# Altium schematic sheet Phaser.SchDoc: =DocumentName
size A3; DocumentNumber: 1; Revision: 0; SheetNumber: 1; SheetTotal: 30
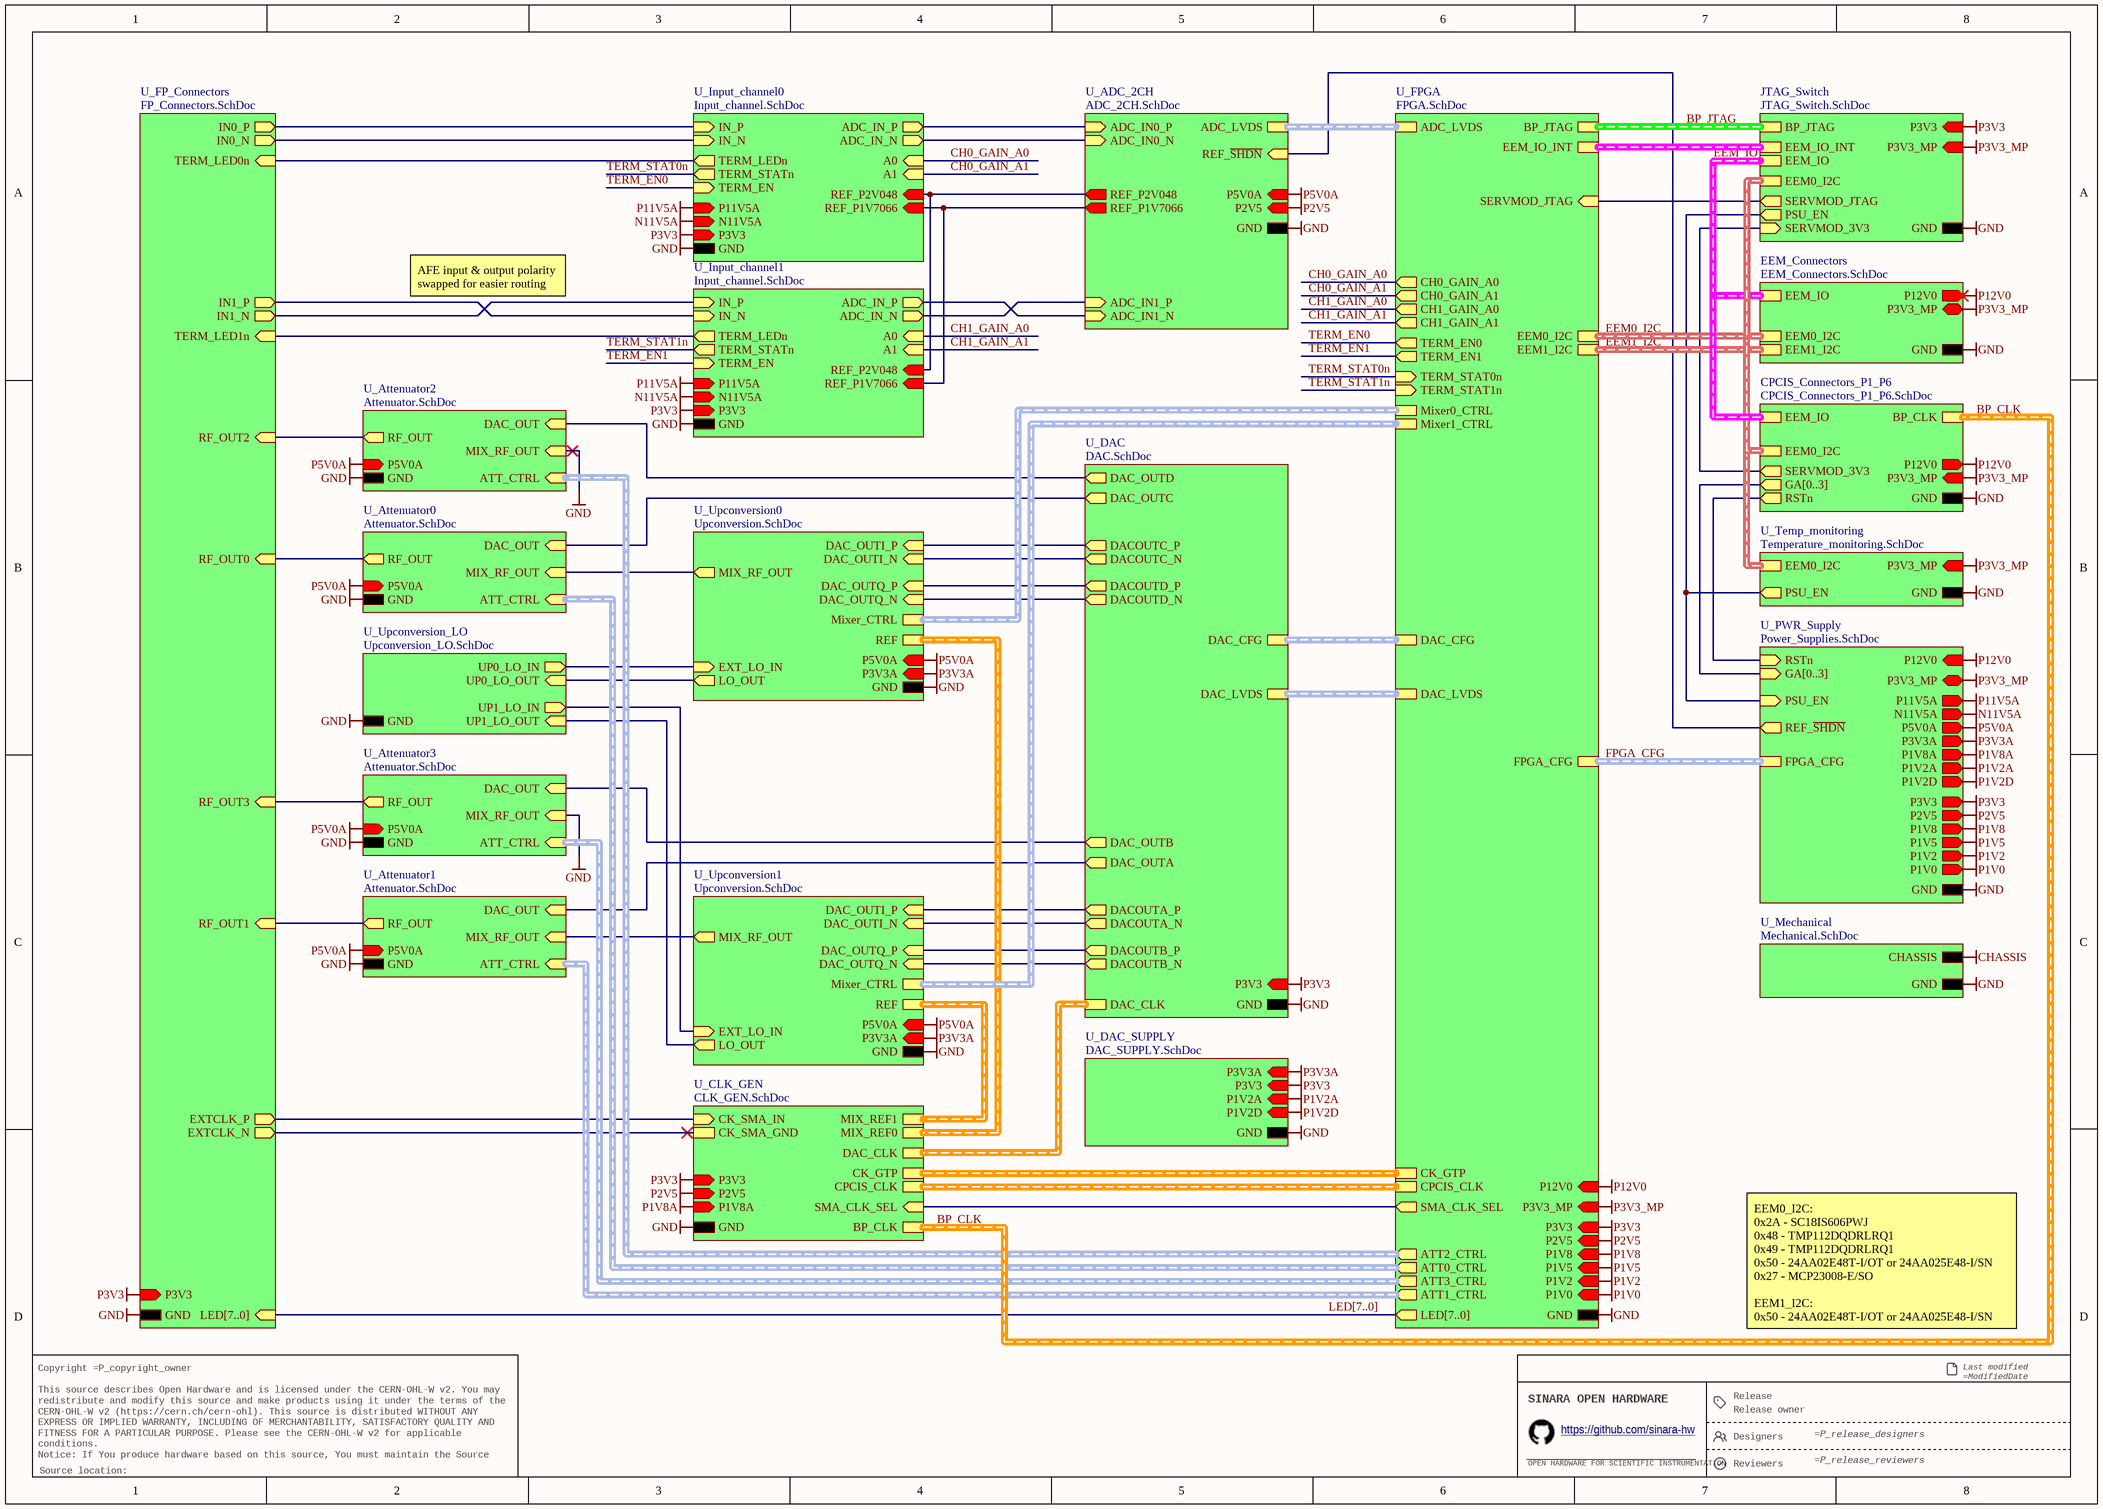
[diagram p0: Phaser.SchDoc]

## Sub-sheets
CPCIS_Connectors_P1_P6 = CPCIS_Connectors_P1_P6.SchDoc: EEM_IO (harness EEM_LVDS), BP_CLK (harness CLK_DIFF), EEM0_I2C (harness I2C), SERVMOD_3V3 (out), GA[0..3] (out), RSTn (out), GND, P3V3_MP (in), P12V0 (out)
EEM_Connectors = EEM_Connectors.SchDoc: P3V3_MP (bidir), P12V0 (out), EEM_IO (harness EEM_LVDS), EEM1_I2C (harness I2C), EEM0_I2C (harness I2C), GND
JTAG_Switch = JTAG_Switch.SchDoc: BP_JTAG (harness BP_JTAG), EEM_IO_INT (harness EEM_LVDS), P3V3_MP (in), P3V3 (in), EEM0_I2C (harness I2C), EEM_IO (harness EEM_LVDS), SERVMOD_3V3 (in), PSU_EN (out), SERVMOD_JTAG (out), GND
U_ADC_2CH = ADC_2CH.SchDoc: REF_~{SHDN} (in), ADC_IN0_P (in), ADC_IN1_P (in), ADC_IN0_N (in), ADC_IN1_N (in), ADC_LVDS (harness ADC_LVDS), P5V0A (in), P2V5 (in), REF_P2V048 (out), REF_P1V7066 (out), GND
U_Attenuator0 = Attenuator.SchDoc: RF_OUT (out), ATT_CTRL (in, harness ATT_CTRL), DAC_OUT (in), MIX_RF_OUT (in), GND, P5V0A (in)
U_Attenuator1 = Attenuator.SchDoc: RF_OUT (out), ATT_CTRL (in, harness ATT_CTRL), DAC_OUT (in), MIX_RF_OUT (in), GND, P5V0A (in)
U_Attenuator2 = Attenuator.SchDoc: RF_OUT (out), DAC_OUT (in), MIX_RF_OUT (in), GND, P5V0A (in), ATT_CTRL (in, harness ATT_CTRL)
U_Attenuator3 = Attenuator.SchDoc: RF_OUT (out), DAC_OUT (in), MIX_RF_OUT (in), GND, P5V0A (in), ATT_CTRL (in, harness ATT_CTRL)
U_CLK_GEN = CLK_GEN.SchDoc: CK_SMA_IN (in), SMA_CLK_SEL (in), CK_GTP (harness CLK_DIFF), MIX_REF0 (harness CLK_DIFF), MIX_REF1 (harness CLK_DIFF), DAC_CLK (harness CLK_DIFF), CK_SMA_GND, GND, BP_CLK (harness CLK_DIFF), P2V5 (in), P1V8A (in), CPCIS_CLK (harness CLK_DIFF), P3V3 (in)
U_DAC = DAC.SchDoc: DAC_CFG (harness DAC_CFG), DAC_LVDS (harness DAC_LVDS), DAC_CLK (harness CLK_DIFF), DAC_OUTC (out), DAC_OUTA (out), DACOUTD_P (out), DACOUTD_N (out), DACOUTC_N (out), DACOUTC_P (out), DACOUTA_P (out), DACOUTA_N (out), DACOUTB_N (out), DACOUTB_P (out), GND, P3V3 (in), DAC_OUTD (out), DAC_OUTB (out)
U_DAC_SUPPLY = DAC_SUPPLY.SchDoc: P3V3A (in), P3V3 (in), P1V2A (in), P1V2D (in), GND
U_FP_Connectors = FP_Connectors.SchDoc: GND, P3V3 (in), IN0_P (out), IN0_N (out), IN1_P (out), IN1_N (out), RF_OUT2 (in), RF_OUT1 (in), EXTCLK_P (out), EXTCLK_N (out), RF_OUT0 (in), RF_OUT3 (in), LED[7..0] (in), TERM_LED0n (in), TERM_LED1n (in)
U_FPGA = FPGA.SchDoc: ADC_LVDS (harness ADC_LVDS), DAC_CFG (harness DAC_CFG), DAC_LVDS (harness DAC_LVDS), LED[7..0] (out), TERM_STAT1n (in), TERM_STAT0n (in), Mixer1_CTRL (harness Mixer_CTRL), Mixer0_CTRL (harness Mixer_CTRL), ATT2_CTRL (out, harness ATT_CTRL), SMA_CLK_SEL (out), GND, CK_GTP (harness CLK_DIFF), CPCIS_CLK (harness CLK_DIFF), P1V2 (in), P2V5 (in), P3V3 (in), P3V3_MP (in), P1V5 (in), P1V8 (in), P1V0 (in), P12V0 (in), ATT0_CTRL (out, harness ATT_CTRL), ATT3_CTRL (out, harness ATT_CTRL), ATT1_CTRL (out, harness ATT_CTRL), CH0_GAIN_A0 (out), CH0_GAIN_A1 (out), CH1_GAIN_A0 (out), CH1_GAIN_A1 (out), TERM_EN0 (out), TERM_EN1 (out), EEM_IO_INT (harness EEM_LVDS), BP_JTAG (harness BP_JTAG), SERVMOD_JTAG (in), FPGA_CFG (harness FPGA_CFG), EEM1_I2C (harness I2C), EEM0_I2C (harness I2C)
U_Input_channel0 = Input_channel.SchDoc: IN_N (in), A0 (in), A1 (in), IN_P (in), ADC_IN_P (out), ADC_IN_N (out), REF_P1V7066 (in), REF_P2V048 (in), GND, TERM_STATn (out), TERM_EN (in), P11V5A (in), N11V5A (in), P3V3 (in), TERM_LEDn (out)
U_Input_channel1 = Input_channel.SchDoc: IN_N (in), A0 (in), A1 (in), IN_P (in), ADC_IN_P (out), ADC_IN_N (out), TERM_STATn (out), REF_P1V7066 (in), REF_P2V048 (in), GND, TERM_EN (in), P11V5A (in), N11V5A (in), P3V3 (in), TERM_LEDn (out)
U_Mechanical = Mechanical.SchDoc: CHASSIS, GND
U_PWR_Supply = Power_Supplies.SchDoc: P12V0 (in), P3V3_MP (bidir), GND, P5V0A (out), P3V3A (out), P1V8A (out), P1V2A (out), P1V2D (out), P3V3 (out), P2V5 (out), P1V8 (out), P1V5 (out), P1V2 (out), P1V0 (out), P11V5A (out), N11V5A (out), RSTn (in), GA[0..3] (in), PSU_EN (in), REF_~{SHDN} (out), FPGA_CFG (harness FPGA_CFG)
U_Temp_monitoring = Temperature_monitoring.SchDoc: GND, P3V3_MP (in), EEM0_I2C (harness I2C), PSU_EN (out)
U_Upconversion0 = Upconversion.SchDoc: DAC_OUTI_P (in), DAC_OUTI_N (in), DAC_OUTQ_N (in), DAC_OUTQ_P (in), REF (harness CLK_DIFF), MIX_RF_OUT (out), Mixer_CTRL (harness Mixer_CTRL), EXT_LO_IN (in), LO_OUT (out), P5V0A (in), P3V3A (in), GND
U_Upconversion1 = Upconversion.SchDoc: DAC_OUTI_P (in), DAC_OUTI_N (in), DAC_OUTQ_N (in), DAC_OUTQ_P (in), REF (harness CLK_DIFF), MIX_RF_OUT (out), Mixer_CTRL (harness Mixer_CTRL), EXT_LO_IN (in), LO_OUT (out), P5V0A (in), P3V3A (in), GND
U_Upconversion_LO = Upconversion_LO.SchDoc: GND, UP0_LO_IN (out), UP0_LO_OUT (in), UP1_LO_IN (out), UP1_LO_OUT (in)

## Nets
CHASSIS: sheet U_Mechanical/CHASSIS
GND: sheet U_PWR_Supply/GND, sheet CPCIS_Connectors_P1_P6/GND, sheet EEM_Connectors/GND, sheet U_Temp_monitoring/GND, sheet U_Mechanical/GND, sheet U_FPGA/GND, sheet U_FP_Connectors/GND, sheet U_CLK_GEN/GND, sheet U_Input_channel0/GND, sheet U_DAC/GND, sheet U_Upconversion0/GND, sheet U_DAC_SUPPLY/GND, sheet U_Input_channel1/GND, sheet U_ADC_2CH/GND, sheet U_Upconversion_LO/GND, sheet U_Upconversion1/GND, sheet U_Attenuator0/GND, sheet U_Attenuator2/MIX_RF_OUT, sheet U_Attenuator2/GND, sheet U_Attenuator1/GND, sheet U_Attenuator3/MIX_RF_OUT, sheet U_Attenuator3/GND, sheet JTAG_Switch/GND
N11V5A: sheet U_PWR_Supply/N11V5A, sheet U_Input_channel0/N11V5A, sheet U_Input_channel1/N11V5A
P1V0: sheet U_PWR_Supply/P1V0, sheet U_FPGA/P1V0
P1V2: sheet U_PWR_Supply/P1V2, sheet U_FPGA/P1V2
P1V2A: sheet U_PWR_Supply/P1V2A, sheet U_DAC_SUPPLY/P1V2A
P1V2D: sheet U_PWR_Supply/P1V2D, sheet U_DAC_SUPPLY/P1V2D
P1V5: sheet U_PWR_Supply/P1V5, sheet U_FPGA/P1V5
P1V8: sheet U_PWR_Supply/P1V8, sheet U_FPGA/P1V8
P1V8A: sheet U_PWR_Supply/P1V8A, sheet U_CLK_GEN/P1V8A
P2V5: sheet U_PWR_Supply/P2V5, sheet U_FPGA/P2V5, sheet U_CLK_GEN/P2V5, sheet U_ADC_2CH/P2V5
P3V3: sheet U_PWR_Supply/P3V3, sheet U_FPGA/P3V3, sheet U_FP_Connectors/P3V3, sheet U_CLK_GEN/P3V3, sheet U_Input_channel0/P3V3, sheet U_DAC/P3V3, sheet U_DAC_SUPPLY/P3V3, sheet U_Input_channel1/P3V3, sheet JTAG_Switch/P3V3
P3V3_MP: sheet U_PWR_Supply/P3V3_MP, sheet CPCIS_Connectors_P1_P6/P3V3_MP, sheet EEM_Connectors/P3V3_MP, sheet U_Temp_monitoring/P3V3_MP, sheet U_FPGA/P3V3_MP, sheet JTAG_Switch/P3V3_MP
P3V3A: sheet U_PWR_Supply/P3V3A, sheet U_Upconversion0/P3V3A, sheet U_DAC_SUPPLY/P3V3A, sheet U_Upconversion1/P3V3A
P5V0A: sheet U_PWR_Supply/P5V0A, sheet U_Upconversion0/P5V0A, sheet U_ADC_2CH/P5V0A, sheet U_Upconversion1/P5V0A, sheet U_Attenuator0/P5V0A, sheet U_Attenuator2/P5V0A, sheet U_Attenuator1/P5V0A, sheet U_Attenuator3/P5V0A
P11V5A: sheet U_PWR_Supply/P11V5A, sheet U_Input_channel0/P11V5A, sheet U_Input_channel1/P11V5A
P12V0: sheet U_PWR_Supply/P12V0, sheet CPCIS_Connectors_P1_P6/P12V0, sheet EEM_Connectors/P12V0, sheet U_FPGA/P12V0
CH0_GAIN_A0: sheet U_FPGA/CH0_GAIN_A0, sheet U_Input_channel0/A0
CH0_GAIN_A1: sheet U_FPGA/CH0_GAIN_A1, sheet U_Input_channel0/A1
CH1_GAIN_A0: sheet U_FPGA/CH1_GAIN_A0, sheet U_Input_channel1/A0
CH1_GAIN_A1: sheet U_FPGA/CH1_GAIN_A1, sheet U_Input_channel1/A1
TERM_EN0: sheet U_FPGA/TERM_EN0, sheet U_Input_channel0/TERM_EN
TERM_EN1: sheet U_FPGA/TERM_EN1, sheet U_Input_channel1/TERM_EN
TERM_STAT0n: sheet U_FPGA/TERM_STAT0n, sheet U_Input_channel0/TERM_STATn
TERM_STAT1n: sheet U_FPGA/TERM_STAT1n, sheet U_Input_channel1/TERM_STATn
(unnamed): sheet U_PWR_Supply/RSTn, sheet CPCIS_Connectors_P1_P6/RSTn
(unnamed): sheet U_PWR_Supply/PSU_EN, sheet U_Temp_monitoring/PSU_EN, sheet JTAG_Switch/PSU_EN
(unnamed): sheet U_PWR_Supply/REF_~{SHDN}, sheet U_ADC_2CH/REF_~{SHDN}
(unnamed): sheet CPCIS_Connectors_P1_P6/SERVMOD_3V3, sheet JTAG_Switch/SERVMOD_3V3
(unnamed): sheet U_FPGA/SMA_CLK_SEL, sheet U_CLK_GEN/SMA_CLK_SEL
(unnamed): sheet U_FPGA/SERVMOD_JTAG, sheet JTAG_Switch/SERVMOD_JTAG
(unnamed): sheet U_FP_Connectors/IN0_P, sheet U_Input_channel0/IN_P
(unnamed): sheet U_FP_Connectors/IN0_N, sheet U_Input_channel0/IN_N
(unnamed): sheet U_FP_Connectors/IN1_P, sheet U_Input_channel1/IN_N
(unnamed): sheet U_FP_Connectors/IN1_N, sheet U_Input_channel1/IN_P
(unnamed): sheet U_FP_Connectors/RF_OUT2, sheet U_Attenuator2/RF_OUT
(unnamed): sheet U_FP_Connectors/RF_OUT1, sheet U_Attenuator1/RF_OUT
(unnamed): sheet U_FP_Connectors/EXTCLK_P, sheet U_CLK_GEN/CK_SMA_IN
(unnamed): sheet U_FP_Connectors/EXTCLK_N, sheet U_CLK_GEN/CK_SMA_GND
(unnamed): sheet U_FP_Connectors/RF_OUT0, sheet U_Attenuator0/RF_OUT
(unnamed): sheet U_FP_Connectors/RF_OUT3, sheet U_Attenuator3/RF_OUT
(unnamed): sheet U_FP_Connectors/TERM_LED0n, sheet U_Input_channel0/TERM_LEDn
(unnamed): sheet U_FP_Connectors/TERM_LED1n, sheet U_Input_channel1/TERM_LEDn
(unnamed): sheet U_Input_channel0/ADC_IN_P, sheet U_ADC_2CH/ADC_IN0_P
(unnamed): sheet U_Input_channel0/ADC_IN_N, sheet U_ADC_2CH/ADC_IN0_N
(unnamed): sheet U_Input_channel0/REF_P1V7066, sheet U_Input_channel1/REF_P1V7066, sheet U_ADC_2CH/REF_P1V7066
(unnamed): sheet U_Input_channel0/REF_P2V048, sheet U_Input_channel1/REF_P2V048, sheet U_ADC_2CH/REF_P2V048
(unnamed): sheet U_DAC/DAC_OUTC, sheet U_Attenuator0/DAC_OUT
(unnamed): sheet U_DAC/DAC_OUTA, sheet U_Attenuator1/DAC_OUT
(unnamed): sheet U_DAC/DACOUTD_P, sheet U_Upconversion0/DAC_OUTQ_P
(unnamed): sheet U_DAC/DACOUTD_N, sheet U_Upconversion0/DAC_OUTQ_N
(unnamed): sheet U_DAC/DACOUTC_N, sheet U_Upconversion0/DAC_OUTI_N
(unnamed): sheet U_DAC/DACOUTC_P, sheet U_Upconversion0/DAC_OUTI_P
(unnamed): sheet U_DAC/DACOUTA_P, sheet U_Upconversion1/DAC_OUTI_P
(unnamed): sheet U_DAC/DACOUTA_N, sheet U_Upconversion1/DAC_OUTI_N
(unnamed): sheet U_DAC/DACOUTB_N, sheet U_Upconversion1/DAC_OUTQ_N
(unnamed): sheet U_DAC/DACOUTB_P, sheet U_Upconversion1/DAC_OUTQ_P
(unnamed): sheet U_DAC/DAC_OUTD, sheet U_Attenuator2/DAC_OUT
(unnamed): sheet U_DAC/DAC_OUTB, sheet U_Attenuator3/DAC_OUT
(unnamed): sheet U_Upconversion0/MIX_RF_OUT, sheet U_Attenuator0/MIX_RF_OUT
(unnamed): sheet U_Upconversion0/EXT_LO_IN, sheet U_Upconversion_LO/UP0_LO_IN
(unnamed): sheet U_Upconversion0/LO_OUT, sheet U_Upconversion_LO/UP0_LO_OUT
(unnamed): sheet U_Input_channel1/ADC_IN_P, sheet U_ADC_2CH/ADC_IN1_N
(unnamed): sheet U_Input_channel1/ADC_IN_N, sheet U_ADC_2CH/ADC_IN1_P
(unnamed): sheet U_Upconversion_LO/UP1_LO_IN, sheet U_Upconversion1/EXT_LO_IN
(unnamed): sheet U_Upconversion_LO/UP1_LO_OUT, sheet U_Upconversion1/LO_OUT
(unnamed): sheet U_Upconversion1/MIX_RF_OUT, sheet U_Attenuator1/MIX_RF_OUT

## Buses and harness runs
bus LED[7..0] = sheet U_FP_Connectors/LED[7..0] = sheet U_FPGA/LED[7..0]
bus sheet CPCIS_Connectors_P1_P6/GA[0..3] = sheet U_PWR_Supply/GA[0..3]
harness BP_CLK = sheet CPCIS_Connectors_P1_P6/BP_CLK = sheet U_CLK_GEN/BP_CLK
harness BP_JTAG = sheet JTAG_Switch/BP_JTAG = sheet U_FPGA/BP_JTAG
harness EEM0_I2C = sheet CPCIS_Connectors_P1_P6/EEM0_I2C = sheet EEM_Connectors/EEM0_I2C = sheet JTAG_Switch/EEM0_I2C = sheet U_FPGA/EEM0_I2C = sheet U_Temp_monitoring/EEM0_I2C
harness EEM1_I2C = sheet EEM_Connectors/EEM1_I2C = sheet U_FPGA/EEM1_I2C
harness EEM_IO = sheet CPCIS_Connectors_P1_P6/EEM_IO = sheet EEM_Connectors/EEM_IO = sheet JTAG_Switch/EEM_IO
harness FPGA_CFG = sheet U_FPGA/FPGA_CFG = sheet U_PWR_Supply/FPGA_CFG
harness sheet JTAG_Switch/EEM_IO_INT = sheet U_FPGA/EEM_IO_INT
harness sheet U_ADC_2CH/ADC_LVDS = sheet U_FPGA/ADC_LVDS
harness sheet U_Attenuator0/ATT_CTRL = sheet U_FPGA/ATT0_CTRL
harness sheet U_Attenuator1/ATT_CTRL = sheet U_FPGA/ATT1_CTRL
harness sheet U_Attenuator2/ATT_CTRL = sheet U_FPGA/ATT2_CTRL
harness sheet U_Attenuator3/ATT_CTRL = sheet U_FPGA/ATT3_CTRL
harness sheet U_CLK_GEN/CK_GTP = sheet U_FPGA/CK_GTP
harness sheet U_CLK_GEN/CPCIS_CLK = sheet U_FPGA/CPCIS_CLK
harness sheet U_CLK_GEN/DAC_CLK = sheet U_DAC/DAC_CLK
harness sheet U_CLK_GEN/MIX_REF0 = sheet U_Upconversion0/REF
harness sheet U_CLK_GEN/MIX_REF1 = sheet U_Upconversion1/REF
harness sheet U_DAC/DAC_CFG = sheet U_FPGA/DAC_CFG
harness sheet U_DAC/DAC_LVDS = sheet U_FPGA/DAC_LVDS
harness sheet U_FPGA/Mixer0_CTRL = sheet U_Upconversion0/Mixer_CTRL
harness sheet U_FPGA/Mixer1_CTRL = sheet U_Upconversion1/Mixer_CTRL

## Notes on the sheet
- AFE input & output polarity swapped for easier routing
- EEM0_I2C:
  0x2A - SC18IS606PWJ
  0x48 - TMP112DQDRLRQ1
  0x49 - TMP112DQDRLRQ1
  0x50 - 24AA02E48T-I/OT or 24AA025E48-I/SN
  0x27 - MCP23008-E/SO
  EEM1_I2C:
  0x50 - 24AA02E48T-I/OT or 24AA025E48-I/SN
- Release
- Last modified =ModifiedDate
  Sheet =sheetnumber of =sheettotal · Size A3
- Copyright =P_copyright_owner
  This source describes Open Hardware and is licensed under the CERN-OHL-W v2. You may redistribute and modify this source and make products using it under the terms of the CERN-OHL-W v2 (https://cern.ch/cern-ohl). This source is distributed WITHOUT ANY EXPRESS OR IMPLIED WARRANTY, INCLUDING OF MERCHANTABILITY, SATISFACTORY QUALITY AND FITNESS FOR A PARTICULAR PURPOSE. Please see the CERN-OHL-W v2 for applicable conditions.
  Notice: If You produce hardware based on this source, You must maintain the Source Location visible on the product, its packaging or its documentation.
- SINARA OPEN HARDWARE
- OPEN HARDWARE FOR SCIENTIFIC INSTRUMENTATION
- https://github.com/sinara-hw
- Release owner
- Designers
- Reviewers
- Source location: